# EasyEDA Pro project esp32s3clock.epro, schematic Schematic3
Assembly Variant: Basic; Board Name: Board3; Create Date: 2026-11-11; Page Name: P1; Project Name: ESPRESSIF32-S3_CLOCK_BAT; Schematic Name: Schematic3; Update Date: 2026-11-11; Company: 嘉立创EDA; Page Size: A4; Version: v4.0_lite
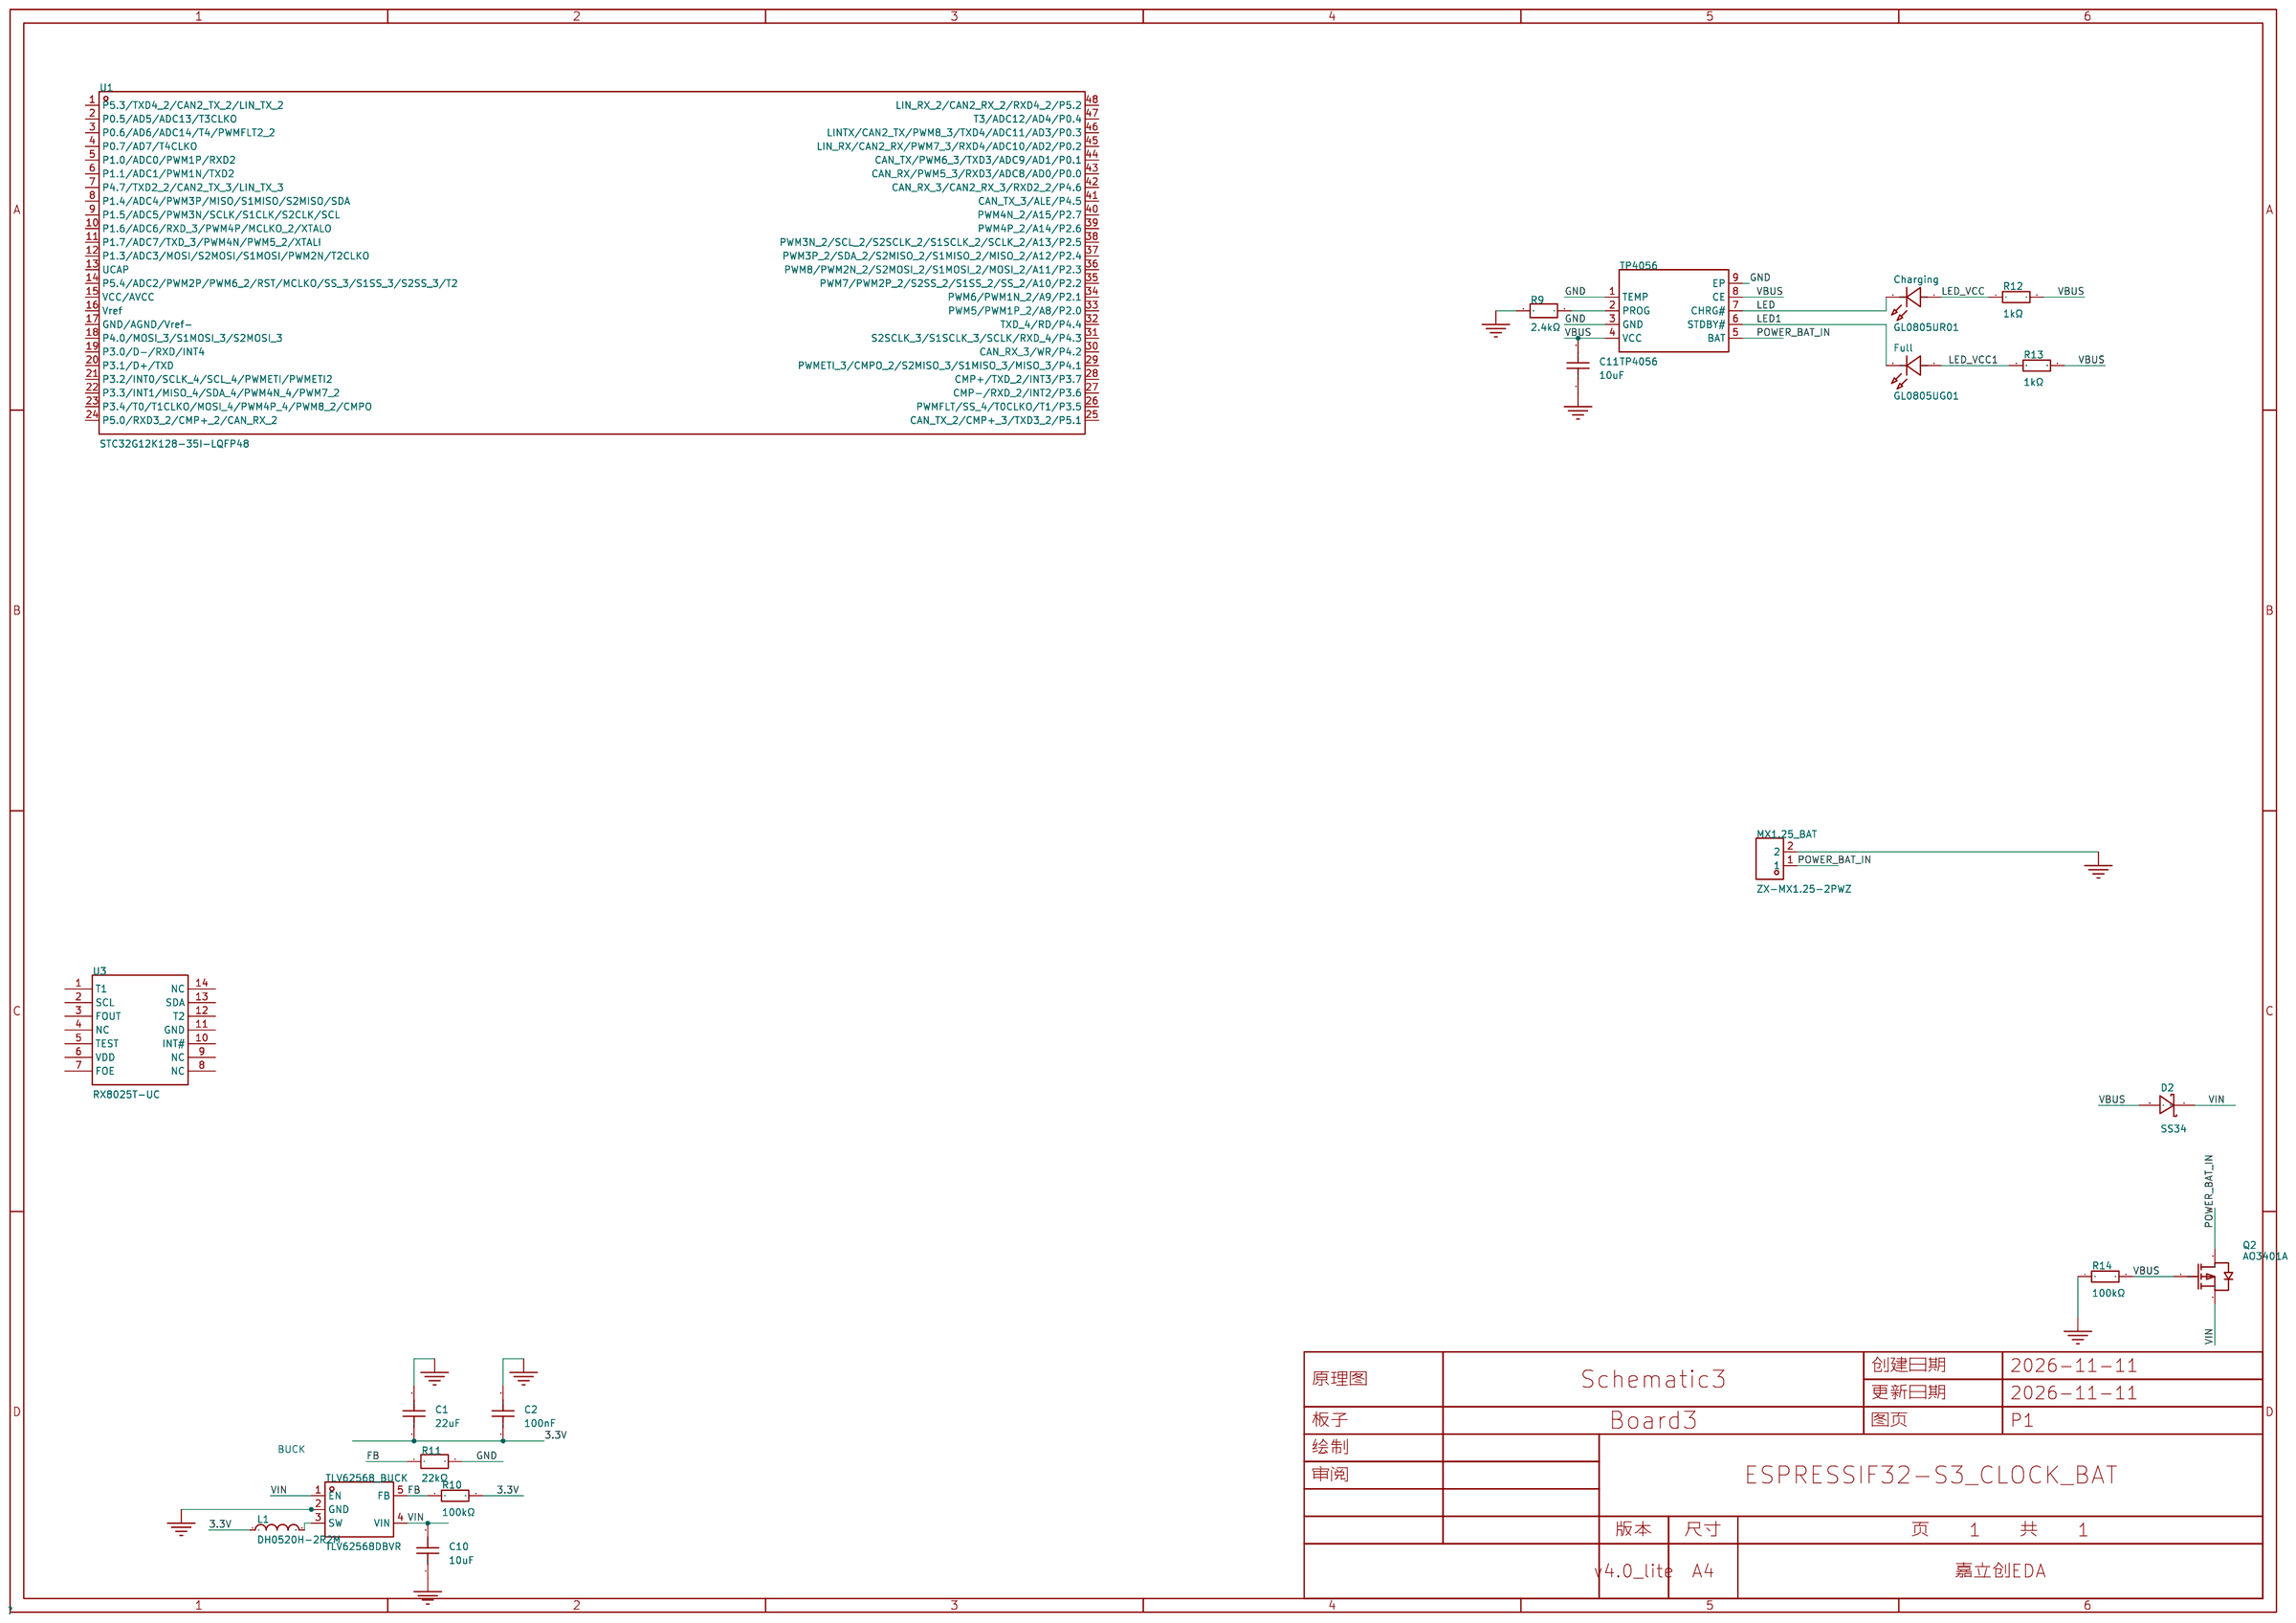
[diagram p4: schematic sheet]

## Parts
C1  22uF  [C1210]
C2  100nF  [C0805]
C10  10uF  [C0805]
C11  10uF  [C0805]
Charging  GL0805UR01  [LED0805-R-RD_RED]
D2  SS34  [SMC_L6.9-W5.9-LS7.9-RD]
Full  GL0805UG01  [LED0805-FD_GL0805UG01]
L1  DH0520H-2R2M  [IND-SMD_L5.6-W5.2_MST0530H-150M]
MX1.25_BAT  ZX-MX1.25-2PWZ  [CONN-TH_2P-P1.25_ZX-MX1.25-2PWZ]
Q2  AO3401A  [SOT-23_L2.9-W1.3-P1.90-LS2.4-BR]
R9  2.4kΩ  [R0603]
R10  100kΩ  [R0805]
R11  22kΩ  [R0805]
R12  1kΩ  [R0805]
R13  1kΩ  [R0805]
R14  100kΩ  [R0805]
TLV62568_BUCK  TLV62568DBVR  [SOT-23-5_L3.0-W1.7-P0.95-LS2.8-BR]
TP4056  TP4056  [ESOP-8_L4.9-W3.9-P1.27-LS6.0-BL-EP]
U1  STC32G12K128-35I-LQFP48  [LQFP-48_L7.0-W7.0-P0.50-LS9.0-BL]
U3  RX8025T-UC  [SOIC-14_L10.1-W5.0-P1.27-LS7.4-BL]

## Library data of the parts
C1 = CL32A226KAJNNNE: 容值:22uF;精度:±10%;额定电压:25V;温度系数:X5R;; LCSC Part Name: 22uF ±10% 25V; Supplier Part: C52306; Manufacturer: SAMSUNG(三星); Supplier Footprint: 1210; JLCPCB Part Class: Extended Part; Datasheet: https://item.szlcsc.com/datasheet/CL32A226KAJNNNE/53320.html; Supplier: LCSC; Tolerance: ±10%; Voltage Rating: 25V; Temperature Coefficient: X5R
C2 = CL21B104KBCNNNC: 容值:100nF;精度:±10%;额定电压:50V;温度系数:X7R;; LCSC Part Name: 100nF ±10% 50V; Supplier Part: C1711; Manufacturer: SAMSUNG(三星); Supplier Footprint: 0805; JLCPCB Part Class: Extended Part; Datasheet: https://item.szlcsc.com/datasheet/CL21B104KBCNNNC/2063.html; Supplier: LCSC; Tolerance: ±10%; Voltage Rating: 50V; Temperature Coefficient: X7R
C10 C11 = CL21A106KAYNNNE_C15850: 容值:10uF;精度:±10%;额定电压:25V;温度系数:X5R;; LCSC Part Name: 10uF ±10% 25V; Supplier Part: C15850; Manufacturer: SAMSUNG(三星); Manufacturer Part: CL21A106KAYNNNE; Supplier Footprint: 0805; JLCPCB Part Class: Basic Part; Datasheet: https://item.szlcsc.com/datasheet/CL21A106KAYNNNE/16532.html; Supplier: LCSC; Tolerance: ±10%; Voltage Rating: 25V; Temperature Coefficient: X5R
Charging = GL0805UR01: 灯头类型:2mmx1.25mm方形灯头;发光颜色:红色;正向压降(Vf):1.8V~2.1V;功率:-;测试电流:20mA;波长:620nm~625nm;二极管配置:独立二极管;透镜颜色:无色透明透镜;色温:-;发光强度:80mcd~100mcd;发光角度:120°;载带方式:正贴;工作温度:-40℃~+85℃;; LCSC Part Name: 0805 红灯 高亮; Supplier Part: C51933307; Manufacturer: Guiguang light(桂光光电); Supplier Footprint: 0805; JLCPCB Part Class: Extended Part; Datasheet: https://item.szlcsc.com/datasheet/GL0805UR01/54646003.html; Supplier: LCSC; Lamp Holder Type: 2mmx1.25mm方形灯头; Illumination Color: 红色; Voltage - Forward(Vf): 1.8V~2.1V; Test Current: 20mA; Wavelength - Dominant: 620nm~625nm; Diode Configuration: 独立二极管; Lens Color: 无色透明透镜; Luminous Intensity: 80mcd~100mcd; Viewing Angle: 120°; Mounting Style: 正贴; Operating Temperature: -40℃~+85℃
D2 = SS34_C154551: 正向压降(Vf):500mV@3A;直流反向耐压(Vr):40V;整流电流:3A;; LCSC Part Name: 电压:40V 电流:3A; Supplier Part: C154551; Manufacturer: onsemi(安森美); Supplier Footprint: SMC(DO-214AB); JLCPCB Part Class: Extended Part; Datasheet: https://item.szlcsc.com/datasheet/SS34/165893.html; Supplier: LCSC; Voltage - Forward(Vf@If): 500mV@3A; Voltage - DC Reverse(Vr): 40V; Current - Rectified: 3A; Reverse Leakage Current (Ir): 500uA@40V; Operating Junction Temperature Range: -55℃~+150℃; Non-Repetitive Peak Forward Surge Current: 100A
Full = GL0805UG01: 灯头类型:2mmx1.25mm方形灯头;发光颜色:翠绿色;正向压降(Vf):2.5V~3V;功率:-;测试电流:5mA;波长:510nm~531nm;二极管配置:独立二极管;透镜颜色:无色透明透镜;色温:-;发光强度:144mcd~300mcd;发光角度:120°;载带方式:正贴;工作温度:-40℃~+85℃;; LCSC Part Name: 0805 翠绿 高亮; Supplier Part: C51933308; Manufacturer: Guiguang light(桂光光电); Supplier Footprint: 0805; JLCPCB Part Class: Extended Part; Datasheet: https://item.szlcsc.com/datasheet/GL0805UG01/54646004.html; Supplier: LCSC; Lamp Holder Type: 2mmx1.25mm方形灯头; Illumination Color: 翠绿色; Voltage - Forward(Vf): 2.5V~3V; Test Current: 5mA; Wavelength - Dominant: 510nm~531nm; Diode Configuration: 独立二极管; Lens Color: 无色透明透镜; Luminous Intensity: 144mcd~300mcd; Viewing Angle: 120°; Mounting Style: 正贴; Operating Temperature: -40℃~+85℃
L1 = DH0520H-2R2M: 一体成型电感，功率电感，合金电感，贴片电感.公司通过ISO90001:2015和IATF16949:2016体系认证，产品主要应用于：汽车电子(车灯、车机屏、BMS、自动驾驶控制模块等)、电脑主板(台式、笔记本、平板)、显卡、交换机、路由器、电视机、显示器、音箱、手机、通讯基站、各种机器设备控制板等。; LCSC Part Name: DH0520H-2R2M（2.2uH); Supplier Part: C41407019; Manufacturer: DH(德鸿感应); Supplier Footprint: SMD,5.6x5.2mm; Datasheet: https://item.szlcsc.com/datasheet/DH0520H-2R2M/43206035.html; Supplier: LCSC
MX1.25_BAT = ZX-MX1.25-2PWZ: 插针结构:1x2P;间距:1.25mm;安装方式:弯插;参考系列:PicoBlade(MX 1.25);总PIN数:2P;排数:1;每排PIN数:2;行距:-;额定电流:1A;触头材质:黄铜;触头镀层:锡;工作温度:-25℃~+85℃;; LCSC Part Name: 1x2P 间距:1.25mm 弯插 系列:PicoBlade(MX 1.25); Supplier Part: C7430463; Manufacturer: Megastar(兆星); Supplier Footprint: 弯插,P=1.25mm; JLCPCB Part Class: Extended Part; Datasheet: https://item.szlcsc.com/datasheet/ZX-MX1.25-2PWZ/8430332.html; Supplier: LCSC; Pins Structure: 1x2P; Pitch: 1.25mm; Mounting Type: 弯插; Reference Series: PicoBlade(MX 1.25); Number of Pins: 2P; Number of Rows: 1; Number of PINs Per Row: 2; Current Rating: 1A; Contact Material: 黄铜; Contact Plating: 锡; Operating Temperature: -25℃~+85℃; Voltage Rating: 125V; Plastic Material: LCP; Flame Retardant Rating: UL94V-0; Color: 米色; Z-Height of the Board: 3.3mm; X-Length of Bottom Edge on Board (Spacing Line): 4.4mm; Y-Width of Bottom Edge on Board: 4.6mm
Q2 = AO3401A_C15127: 数量:1个P沟道;漏源电压(Vdss):30V;连续漏极电流(Id):4A;导通电阻(RDS(on)):47mΩ@10V；85mΩ@2.5V；60mΩ@4.5V;耗散功率(Pd):-;阈值电压(Vgs(th)):900mV;; LCSC Part Name: 1个P沟道 耐压:30V 电流:4A; Supplier Part: C15127; Manufacturer: AOS; Supplier Footprint: SOT-23; JLCPCB Part Class: Basic Part; Datasheet: https://item.szlcsc.com/datasheet/AO3401A/15801.html; Supplier: LCSC; Number: 1个P沟道; Drain to Source Voltage: 30V; Current - Continuous Drain(Id): 4A; RDS(on): 47mΩ@10V；85mΩ@2.5V；60mΩ@4.5V; Gate Threshold Voltage (Vgs(th)): 900mV; Gate Charge(Qg): 14nC@10V; Input Capacitance(Ciss): 645pF; Reverse Transfer Capacitance (Crss@Vds): 55pF; Output Capacitance(Coss): 80pF
R9 = FRC0603F2401TS: 电阻类型:厚膜电阻;阻值:2.4kΩ;精度:±1%;功率:100mW;工作电压:75V;温度系数:±100ppm/℃;; LCSC Part Name: 2.4kΩ ±1% 100mW 厚膜电阻; Supplier Part: C2907007; Manufacturer: FOJAN(富捷); Supplier Footprint: 0603; JLCPCB Part Class: Extended Part; Supplier: LCSC; Type: 厚膜电阻; Tolerance: ±1%; Power(Watts): 100mW; Voltage-Supply(Max): 75V; Temperature Coefficient: ±100ppm/℃; Operating Temperature: -55℃~+155℃
R10 R14 = 0805W8F1003T5E: 电阻类型:厚膜电阻;阻值:100kΩ;精度:±1%;功率:125mW;工作电压:150V;温度系数:±100ppm/℃;; LCSC Part Name: 100kΩ ±1% 125mW 厚膜电阻; Supplier Part: C149504; Manufacturer: UNI-ROYAL(厚声); Supplier Footprint: 0805; JLCPCB Part Class: Basic Part; Datasheet: https://item.szlcsc.com/datasheet/0805W8F1003T5E/160838.html; Supplier: LCSC; Type: 厚膜电阻; Tolerance: ±1%; Power(Watts): 125mW; Voltage-Supply(Max): 150V; Temperature Coefficient: ±100ppm/℃; Operating Temperature: -55℃~+155℃
R11 = FRC0805F2202TS: 电阻类型:厚膜电阻;阻值:22kΩ;精度:±1%;功率:125mW;工作电压:150V;温度系数:±100ppm/℃;; LCSC Part Name: 22kΩ ±1% 125mW 厚膜电阻; Supplier Part: C2907243; Manufacturer: FOJAN(富捷); Supplier Footprint: 0805; JLCPCB Part Class: Extended Part; Datasheet: https://item.szlcsc.com/datasheet/FRC0805F2202TS/3180756.html; Supplier: LCSC; Type: 厚膜电阻; Tolerance: ±1%; Power(Watts): 125mW; Voltage-Supply(Max): 150V; Temperature Coefficient: ±100ppm/℃; Operating Temperature: -55℃~+155℃
R12 R13 = 0805W8F1001T5E: 电阻类型:厚膜电阻;阻值:1kΩ;精度:±1%;功率:125mW;最大工作电压:150V;温度系数:±100ppm/℃;; LCSC Part Name: 1kΩ ±1% 125mW 厚膜电阻; Supplier Part: C17513; Manufacturer: UNI-ROYAL(厚声); Supplier Footprint: 0805; JLCPCB Part Class: Basic Part; Datasheet: https://atta.szlcsc.com/upload/public/pdf/source/20200306/C422600_1E6D84923E4A46A82E41ADD87F860B5C.pdf; Supplier: LCSC; Type: 厚膜电阻; Tolerance: ±1%; Power(Watts): 125mW; Overload Voltage (Max): 150V; Temperature Coefficient: ±100ppm/℃; Operating Temperature Range: -55℃~+155℃
TLV62568_BUCK = TLV62568DBVR: 功能类型:降压型;工作电压:2.5V~5.5V;输出电压:600mV~5.5V;输出电流:1A;输出类型:可调;; LCSC Part Name: 降压型 1A 2.5V~5.5V; Supplier Part: C163219; Manufacturer: TI(德州仪器); Supplier Footprint: SOT-23-5; JLCPCB Part Class: Extended Part; Datasheet: https://www.ti.com/cn/lit/ds/symlink/tlv62568.pdf; Supplier: LCSC; Function: 降压型; Voltage - Supply: 2.5V~5.5V; Output Voltage: 600mV~5.5V; Output Current: 1A; Frequency - Switching: 1.5MHz; Operating Temperature: -40℃~+125℃@(TJ); Synchronous Rectifier: 是; Number of Outputs: 1; Topology: 降压式; Quiescent Current: 35uA; Switch tube (built-in/external): 内置; Output Type: 可调; Features: 轻载高效模式；过流保护；工作状态指示
TP4056 = TP4056_C725790: 工作电压:4V~6.5V;最大充电电流:1A;电池类型:锂电池;电池节数:1;; LCSC Part Name: 1A独立式线性锂离子电池充电器; Supplier Part: C725790; Manufacturer: UMW(友台半导体); Supplier Footprint: ESOP-8; JLCPCB Part Class: Extended Part; Datasheet: https://item.szlcsc.com/datasheet/TP4056/772193.html; Supplier: LCSC; The Chip Type: 充电芯片; Voltage - Supply: 4V~6.5V; Charge Current - Max: 1A; Charging Saturation Voltage: 4.2V; Type of Battery: 锂电池; Number of Cells: 1; Operating Temperature: -40℃~+85℃; Battery Temperature Detection: 支持; 0V Battery Charge: 支持; Supply Current (Iq): 35uA; Features: 恒压充电；恒流充电；自动再充电；充电终止；软启动；可编程充电电流；欠压锁定；涓流充电
U1 = STC32G12K128-35I-LQFP48: 特性：32位8051，也是优秀的16位机，更是兼容8位机的1位机。 10个32位累加器。 16个16位累加器。 16个8位累加器。 32位加减指令。 16位乘除指令。 32位乘除运算（MDU32）。 32位算术比较指令。 所有的SFR（80H~FFH）均支持位寻址。 ebdata（20H~7FH）全部支持位寻址。 单时钟32/16/8位数据读写（edata）。 单时钟端口读写。 堆栈理论深度可达64K（实际取决于edata）。 FreeRTOS for STC32G12K128：官方移植的高效稳定版已发布; LCSC Part Name: 车规32位8051单片机; Supplier Part: C5210760; Manufacturer: STC; Supplier Footprint: LQFP-48(7x7); JLCPCB Part Class: Extended Part; Datasheet: https://item.szlcsc.com/datasheet/STC32G12K128-35I-LQFP48/5904696.html; Supplier: LCSC; Program Storage Size: 128KB; ADC (Bit): 12bit; Features: 欠压检测(BOR/LVD/LVR/LVI)；日历功能；上电复位(POR)；看门狗复位；内置通用定时器；软件复位
U3 = RX8025T-UC: 接口类型:I2C;晶振类型:内置;闹钟输出:有;; LCSC Part Name: 内置32.768kHz-DTCXO的高稳定性I²C总线接口实时时钟模块; Supplier Part: C53691; Manufacturer: EPSON(爱普生); Supplier Footprint: SOP-14-208mil; JLCPCB Part Class: Extended Part; Datasheet: https://item.szlcsc.com/datasheet/RX8025T-UC/54707.html; Supplier: LCSC; Interface: I2C; crystal oscillator: 内置; Alarm Output: 有; Voltage - Supply: 1.8V~5.5V; Quiescent Current(Iq): 0.8uA; Operating Temperature: -40℃~+85℃; Features: 可编程时钟输出；周期性中断输出；告警功能；温度补偿

## Nets
3.3V: C1.1 C2.1 L1.1 R10.2
GND: C1.2 C2.2 C10.1 C11.1 MX1.25_BAT.2 R9.1 R11.2 R14.1 TLV62568_BUCK.2(GND) TP4056.1(TEMP) TP4056.3(GND) TP4056.9(EP)
VBUS: C11.2 D2.2(A) Q2.1(G) R12.2 R13.2 R14.2 TP4056.4(VCC) TP4056.8(CE)
VIN: C10.2 D2.1(C) Q2.2(S) TLV62568_BUCK.1(EN) TLV62568_BUCK.4(VIN)
FB: R10.1 R11.1 TLV62568_BUCK.5(FB)
LED: Charging.2(C) TP4056.7(CHRG#)
LED1: Full.2(C) TP4056.6(STDBY#)
LED_VCC: Charging.1(A) R12.1
LED_VCC1: Full.1(A) R13.1
POWER_BAT_IN: MX1.25_BAT.1 Q2.3(D) TP4056.5(BAT)
$1N6: L1.2 TLV62568_BUCK.3(SW)
$1N31: R9.2 TP4056.2(PROG)

Not connected (* = marked no-connect by the designer): U1 1(P5.3/TXD4_2/CAN2_TX_2/LIN_TX_2) 2(P0.5/AD5/ADC13/T3CLKO) 3(P0.6/AD6/ADC14/T4/PWMFLT2_2) 4(P0.7/AD7/T4CLKO) 5(P1.0/ADC0/PWM1P/RXD2) 6(P1.1/ADC1/PWM1N/TXD2) 7(P4.7/TXD2_2/CAN2_TX_3/LIN_TX_3) 8(P1.4/ADC4/PWM3P/MISO/S1MISO/S2MISO/SDA) 9(P1.5/ADC5/PWM3N/SCLK/S1CLK/S2CLK/SCL) 10(P1.6/ADC6/RXD_3/PWM4P/MCLKO_2/XTALO) 11(P1.7/ADC7/TXD_3/PWM4N/PWM5_2/XTALI) 12(P1.3/ADC3/MOSI/S2MOSI/S1MOSI/PWM2N/T2CLKO) 13(UCAP) 14(P5.4/ADC2/PWM2P/PWM6_2/RST/MCLKO/SS_3/S1SS_3/S2SS_3/T2) 15(VCC/AVCC) 16(Vref) 17(GND/AGND/Vref-) 18(P4.0/MOSI_3/S1MOSI_3/S2MOSI_3) 19(P3.0/D-/RXD/INT4) 20(P3.1/D+/TXD) 21(P3.2/INT0/SCLK_4/SCL_4/PWMETI/PWMETI2) 22(P3.3/INT1/MISO_4/SDA_4/PWM4N_4/PWM7_2) 23(P3.4/T0/T1CLKO/MOSI_4/PWM4P_4/PWM8_2/CMPO) 24(P5.0/RXD3_2/CMP+_2/CAN_RX_2) 25(CAN_TX_2/CMP+_3/TXD3_2/P5.1) 26(PWMFLT/SS_4/T0CLKO/T1/P3.5) 27(CMP-/RXD_2/INT2/P3.6) 28(CMP+/TXD_2/INT3/P3.7) 29(PWMETI_3/CMPO_2/S2MISO_3/S1MISO_3/MISO_3/P4.1) 30(CAN_RX_3/WR/P4.2) 31(S2SCLK_3/S1SCLK_3/SCLK/RXD_4/P4.3) 32(TXD_4/RD/P4.4) 33(PWM5/PWM1P_2/A8/P2.0) 34(PWM6/PWM1N_2/A9/P2.1) 35(PWM7/PWM2P_2/S2SS_2/S1SS_2/SS_2/A10/P2.2) 36(PWM8/PWM2N_2/S2MOSI_2/S1MOSI_2/MOSI_2/A11/P2.3) 37(PWM3P_2/SDA_2/S2MISO_2/S1MISO_2/MISO_2/A12/P2.4) 38(PWM3N_2/SCL_2/S2SCLK_2/S1SCLK_2/SCLK_2/A13/P2.5) 39(PWM4P_2/A14/P2.6) 40(PWM4N_2/A15/P2.7) 41(CAN_TX_3/ALE/P4.5) 42(CAN_RX_3/CAN2_RX_3/RXD2_2/P4.6) 43(CAN_RX/PWM5_3/RXD3/ADC8/AD0/P0.0) 44(CAN_TX/PWM6_3/TXD3/ADC9/AD1/P0.1) 45(LIN_RX/CAN2_RX/PWM7_3/RXD4/ADC10/AD2/P0.2) 46(LINTX/CAN2_TX/PWM8_3/TXD4/ADC11/AD3/P0.3) 47(T3/ADC12/AD4/P0.4) 48(LIN_RX_2/CAN2_RX_2/RXD4_2/P5.2); U3 1(T1) 2(SCL) 3(FOUT) 4(NC) 5(TEST) 6(VDD) 7(FOE) 8(NC) 9(NC) 10(INT#) 11(GND) 12(T2) 13(SDA) 14(NC)

## Notes on the sheet
- BUCK
